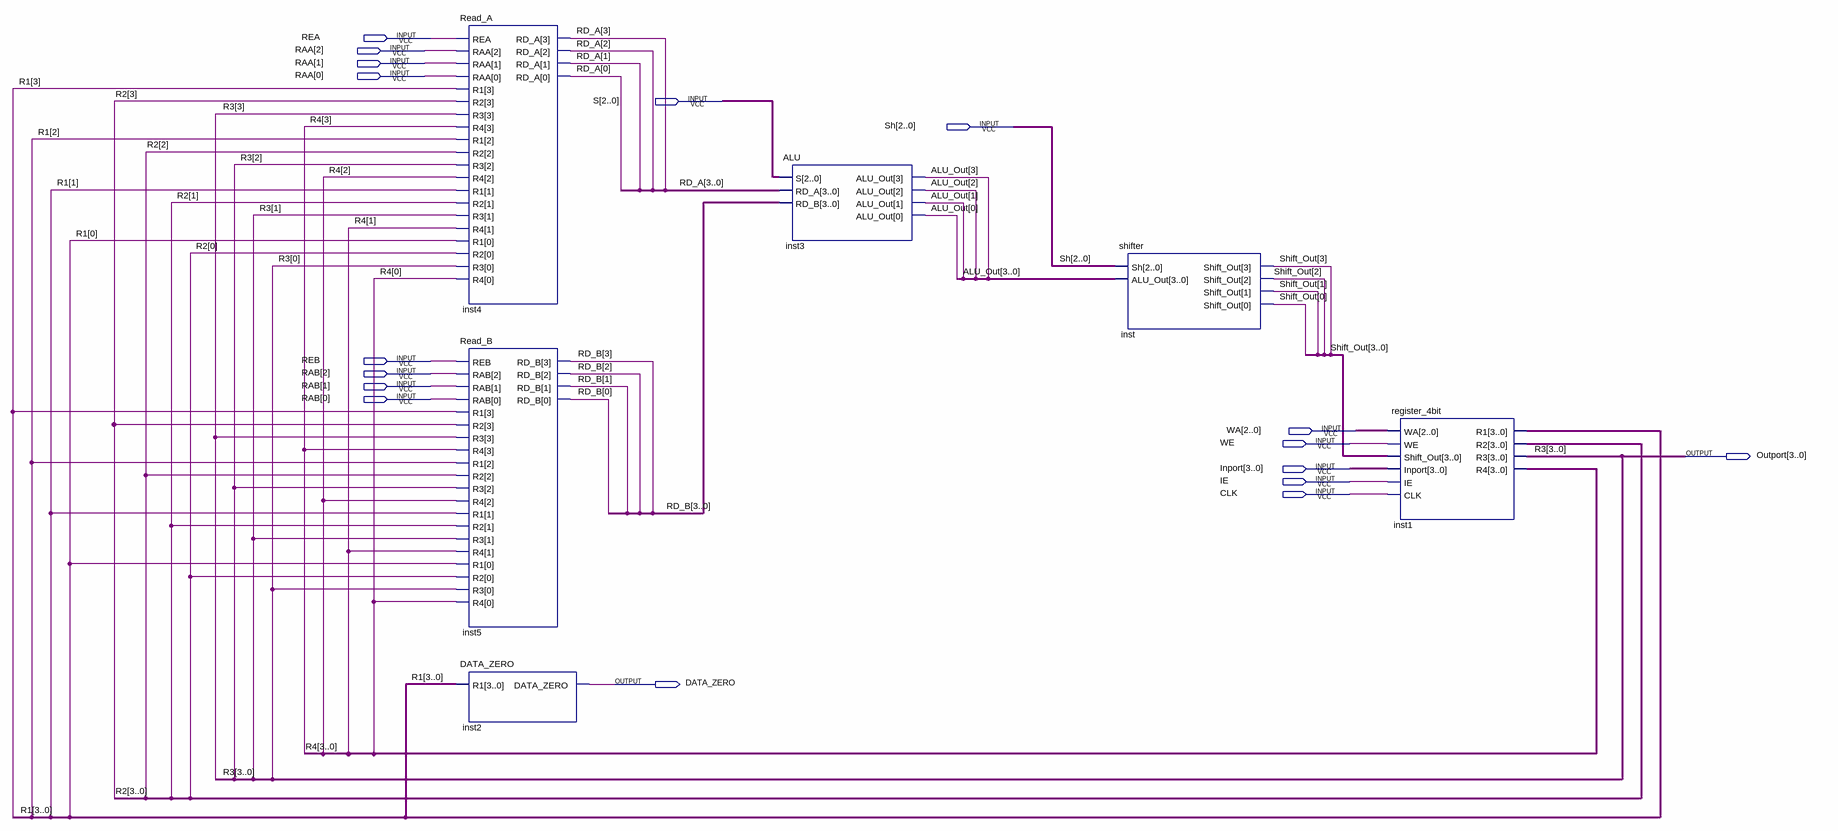
[diagram p0: schematic sheet]
// Quartus schematic datapath.bdf as structural Verilog: 6 symbols, 17 pins
module datapath (
  input  REA,
  input  [2:0] RAA,
  input  [2:0] S,
  input  [2:0] Sh,
  input  REB,
  input  [2:0] RAB,
  input  [2:0] WA,
  input  WE,
  input  [3:0] Inport,
  input  IE,
  input  CLK,
  output [3:0] Outport,
  output DATA_ZERO
);

  wire [3:0] ALU_Out, R1, R2, R4, RD_A, RD_B, Shift_Out;

  Read_A inst4 (.REA(REA), .RAA(RAA), .R1(R1), .R2(R2), .R3(Outport), .R4(R4), .RD_A(RD_A));
  Read_B inst5 (.REB(REB), .RAB(RAB), .R1(R1), .R2(R2), .R3(Outport), .R4(R4), .RD_B(RD_B));
  DATA_ZERO inst2 (.R1(R1), .DATA_ZERO(DATA_ZERO));
  ALU inst3 (.S(S), .RD_A(RD_A), .RD_B(RD_B), .ALU_Out(ALU_Out));
  shifter inst (.Sh(Sh), .ALU_Out(ALU_Out), .Shift_Out(Shift_Out));
  register_4bit inst1 (
    .WA(WA), .WE(WE), .Shift_Out(Shift_Out), .Inport(Inport), .IE(IE), .CLK(CLK), .R1(R1), .R2(R2),
    .R3(Outport), .R4(R4));

  // Other names for the same wires on the sheet: R3[3:0] = Outport
endmodule
